# Altium schematic sheet Relay_Driver.SchDoc
size A; SheetNumber: 3; SheetTotal: 4
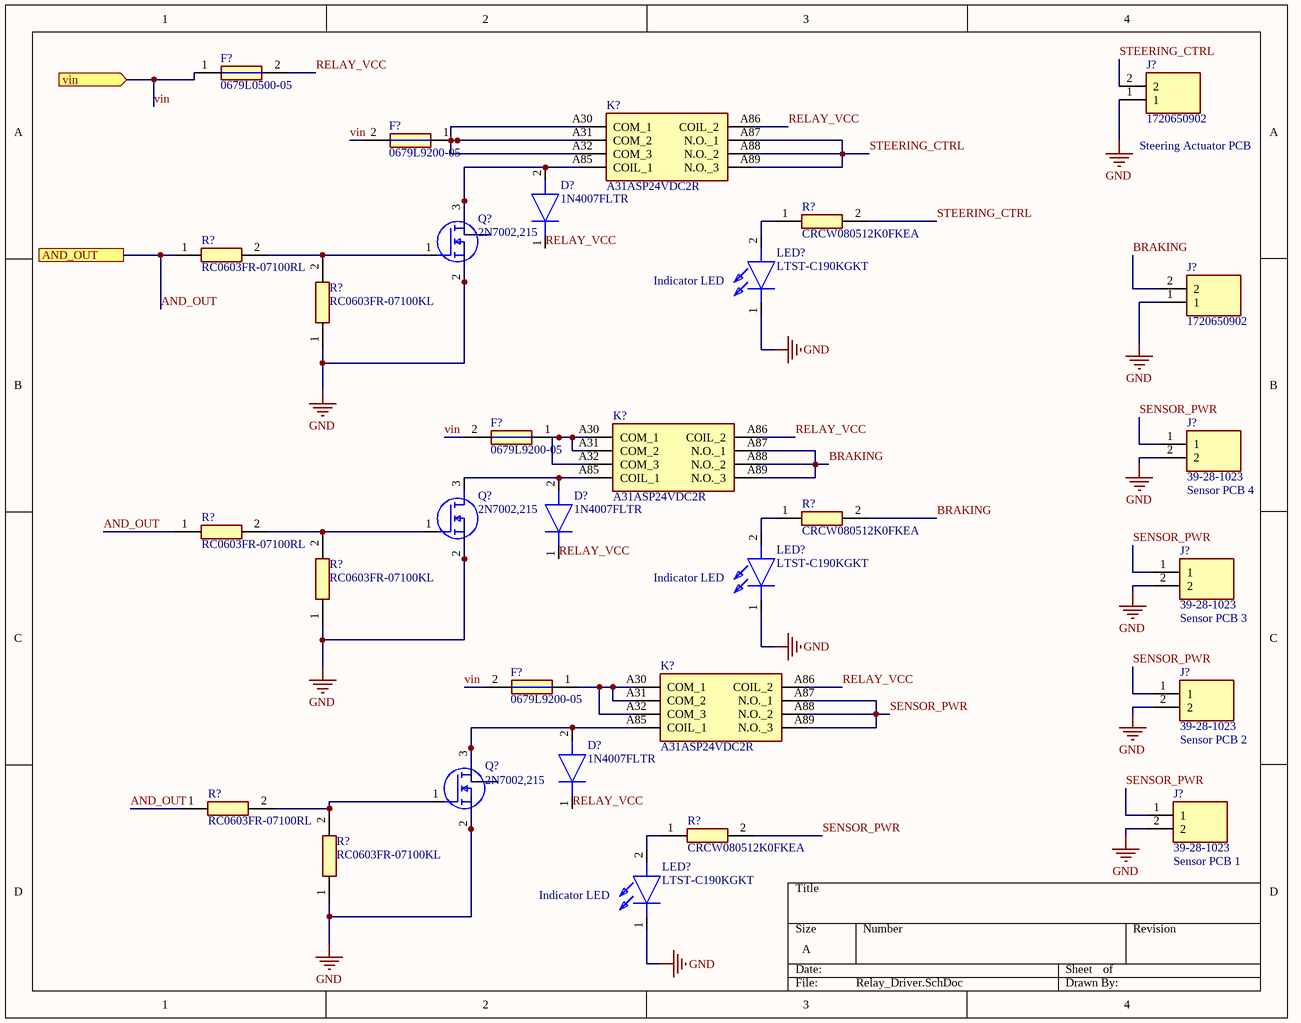
[diagram p0: Relay_Driver.SchDoc]

## Parts
(Parts that share a designator on the sheet are numbered #1, #2 ... from top to bottom, then left to right.)
D?#1  1N4007FLTR  [SODFL3718X140N]
D?#2  1N4007FLTR  [SODFL3718X140N]
D?#3  1N4007FLTR  [SODFL3718X140N]
F?#1  0679L0500-05  [FUSC6125X279N]
F?#2  0679L9200-05  [FUSC6125X279N]
F?#3  0679L9200-05  [FUSC6125X279N]
F?#4  0679L9200-05  [FUSC6125X279N]
J?#1  1720650902  [1720650902]
J?#2  1720650902  [1720650902]
J?#3  39-28-1023  [39-28-1023]
J?#4  39-28-1023  [39-28-1023]
J?#5  39-28-1023  [39-28-1023]
J?#6  39-28-1023  [39-28-1023]
K?#1  A31ASP24VDC2R  [A31ASP24VDC2R]
K?#2  A31ASP24VDC2R  [A31ASP24VDC2R]
K?#3  A31ASP24VDC2R  [A31ASP24VDC2R]
LED?#1  LTST-C190KGKT  [LEDC1608X80N]
LED?#2  LTST-C190KGKT  [LEDC1608X80N]
LED?#3  LTST-C190KGKT  [LEDC1608X80N]
Q?#1  2N7002,215  [SOT95P230X110-3N]
Q?#2  2N7002,215  [SOT95P230X110-3N]
Q?#3  2N7002,215  [SOT95P230X110-3N]
R?#1  CRCW080512K0FKEA  [RESC2012X50N]
R?#2  RC0603FR-07100RL  [RESC1608X55N]
R?#3  RC0603FR-07100KL  [RESC1608X55N]
R?#4  CRCW080512K0FKEA  [RESC2012X50N]
R?#5  RC0603FR-07100RL  [RESC1608X55N]
R?#6  RC0603FR-07100KL  [RESC1608X55N]
R?#7  RC0603FR-07100RL  [RESC1608X55N]
R?#8  CRCW080512K0FKEA  [RESC2012X50N]
R?#9  RC0603FR-07100KL  [RESC1608X55N]

## Ports
AND_OUT, vin (in)

## Nets
GND: J?#1.1 J?#2.1 J?#3.2 J?#4.2 J?#5.2 J?#6.2 LED?#1.1(K) LED?#2.1(K) LED?#3.1(K) Q?#1.2(S) Q?#2.2(S) Q?#3.2(S) R?#3.1 R?#6.1 R?#9.1
AND_OUT: R?#2.1 R?#5.1 R?#7.1 ; port AND_OUT
BRAKING: J?#2.2 K?#2.A87(N.O._1) K?#2.A88(N.O._2) K?#2.A89(N.O._3) R?#4.2
RELAY_VCC: D?#1.1(K) D?#2.1(K) D?#3.1(K) F?#1.2 K?#1.A86(COIL_2) K?#2.A86(COIL_2) K?#3.A86(COIL_2)
SENSOR_PWR: J?#3.1 J?#4.1 J?#5.1 J?#6.1 K?#3.A87(N.O._1) K?#3.A88(N.O._2) K?#3.A89(N.O._3) R?#8.2
STEERING_CTRL: J?#1.2 K?#1.A87(N.O._1) K?#1.A88(N.O._2) K?#1.A89(N.O._3) R?#1.2
vin: F?#1.1 F?#2.2 F?#3.2 F?#4.2 ; port vin
NetD?#1_2: D?#1.2(A) K?#1.A85(COIL_1) Q?#1.3(D)
NetD?#2_2: D?#2.2(A) K?#2.A85(COIL_1) Q?#2.3(D)
NetD?#3_2: D?#3.2(A) K?#3.A85(COIL_1) Q?#3.3(D)
NetF?#2_1: F?#2.1 K?#1.A30(COM_1) K?#1.A31(COM_2) K?#1.A32(COM_3)
NetF?#3_1: F?#3.1 K?#2.A30(COM_1) K?#2.A31(COM_2) K?#2.A32(COM_3)
NetF?#4_1: F?#4.1 K?#3.A30(COM_1) K?#3.A31(COM_2) K?#3.A32(COM_3)
NetLED?#1_2: LED?#1.2(A) R?#1.1
NetLED?#2_2: LED?#2.2(A) R?#4.1
NetLED?#3_2: LED?#3.2(A) R?#8.1
NetQ?#1_1: Q?#1.1(G) R?#2.2 R?#3.2
NetQ?#2_1: Q?#2.1(G) R?#5.2 R?#6.2
NetQ?#3_1: Q?#3.1(G) R?#7.2 R?#9.2

## Notes on the sheet
- (near J?#1) Steering Actuator PCB
- (near LED?#1) Indicator LED
- (near J?#3) Sensor PCB 4
- (near LED?#2) Indicator LED
- (near J?#4) Sensor PCB 3
- (near J?#5) Sensor PCB 2
- (near LED?#3) Indicator LED
- (near J?#6) Sensor PCB 1

## Library data of the parts
D?#1-D?#3 = 1N4007FLTR: Diode; Manufacturer_Name: SMC Diode Solutions; Datasheet Link: http://www.smc-diodes.com/propdf/1N4001FL-1N4007FL%20N1646%20REV.A.pdf; Height: 1.4mm; Manufacturer_Part_Number: 1N4007FLTR
F?#1 = 0679L0500-05: Fuse; Manufacturer_Name: Bel Circuit Protection; Datasheet Link: https://au.mouser.com/datasheet/2/643/ds_cp_0679l_series-1291227.pdf; Height: 2.79mm; Manufacturer_Part_Number: 0679L0500-05; Arrow Part Number: 0679L0500-05; Arrow Price/Stock: https://www.arrow.com/en/products/0679l0500-05/bel-group
F?#2-F?#4 = 0679L9200-05: Fuse; Manufacturer_Name: BelFuse; Datasheet Link: https://mouser.componentsearchengine.com/Datasheets/1/0679L9200-05.pdf; Height: 2.79mm; Manufacturer_Part_Number: 0679L9200-05; Mouser Part Number: 530-0679L9200-05; Mouser Price/Stock: https://www.mouser.co.uk/ProductDetail/Bel-Fuse/0679L9200-05?qs=ZqXcJfGlKsjLkLjgIYVYTw%3D%3D; Arrow Part Number: 0679L9200-05; Arrow Price/Stock: https://www.arrow.com/en/products/0679l9200-05/bel-group
J?#1 J?#2 = 1720650902: Connector; Manufacturer_Name: Molex; Datasheet Link: https://www.molex.com/content/dam/molex/molex-dot-com/products/automated/en-us/salesdrawingpdf/172/172065/1720650902_sd.pdf; Height: 15.2mm; Manufacturer_Part_Number: 1720650902
J?#3-J?#6 = 39-28-1023: Connector; Manufacturer_Name: Molex; Datasheet Link: https://www.molex.com/pdm_docs/sd/039281023_sd.pdf; Height: 12.8mm; Manufacturer_Part_Number: 39-28-1023; Mouser Part Number: 538-39-28-1023; Mouser Price/Stock: https://www.mouser.co.uk/ProductDetail/Molex/39-28-1023?qs=LQQHZ4xw2XBykFU0jRHvlQ%3D%3D; Arrow Part Number: 39-28-1023; Arrow Price/Stock: https://www.arrow.com/en/products/39-28-1023/molex?region=nac
K?#1-K?#3 = A31ASP24VDC2R: Relay or Contactor; Manufacturer_Name: CIT Relay & Switch; Datasheet Link: https://www.citrelay.com/CatalogPages/RelayCatalog/A3.pdf; Height: 27.55mm; Manufacturer_Part_Number: A31ASP24VDC2R
LED?#1-LED?#3 = LTST-C190KGKT: LED; Manufacturer_Name: Lite-On; Datasheet Link: http://uk.rs-online.com/web/p/visible-leds/6920988/; Height: 0.8mm; Manufacturer_Part_Number: LTST-C190KGKT; Mouser Part Number: 859-LTST-C190KGKT; Mouser Price/Stock: https://www.mouser.co.uk/ProductDetail/Lite-On/LTST-C190KGKT?qs=205qCy6M2Q%252BAdcgwUZktqw%3D%3D; Arrow Part Number: LTST-C190KGKT; Arrow Price/Stock: https://www.arrow.com/en/products/ltst-c190kgkt/lite-on-technology.html?utm_currency=USD&region=europe
Q?#1-Q?#3 = 2N7002,215: MOSFET (N-Channel); Manufacturer_Name: Nexperia; Datasheet Link: https://assets.nexperia.com/documents/data-sheet/2N7002.pdf; Height: 1.1mm; Manufacturer_Part_Number: 2N7002,215; Mouser Part Number: 771-2N7002-T/R; Mouser Price/Stock: https://www.mouser.co.uk/ProductDetail/Nexperia/2N7002215?qs=P62ublwmbi9rRKKuNdhqMA%3D%3D; Arrow Part Number: 2N7002,215; Arrow Price/Stock: https://www.arrow.com/en/products/2n7002215/nexperia?utm_currency=USD&region=nac
R?#1 R?#4 R?#8 = CRCW080512K0FKEA: Resistor; Manufacturer_Name: Vishay; Datasheet Link: http://www.vishay.com/docs/20035/dcrcwe3.pdf; Height: 0.5mm; Manufacturer_Part_Number: CRCW080512K0FKEA; Mouser Part Number: 71-CRCW080512K0FKEA; Mouser Price/Stock: https://www.mouser.co.uk/ProductDetail/Vishay-Dale/CRCW080512K0FKEA?qs=0y7Riw94L4gQIm4gt5oa2A%3D%3D; Arrow Part Number: CRCW080512K0FKEA; Arrow Price/Stock: https://www.arrow.com/en/products/crcw080512k0fkea/vishay?region=europe
R?#2 R?#5 R?#7 = RC0603FR-07100RL: Resistor; Manufacturer_Name: Yageo Group; Datasheet Link: http://www.yageo.com/documents/recent/PYu-RC0603_51_RoHS_L_v5.pdf; Height: 0.55mm; Manufacturer_Part_Number: RC0603FR-07100RL; Mouser Part Number: 603-RC0603FR-07100RL; Mouser Price/Stock: https://www.mouser.co.uk/ProductDetail/YAGEO/RC0603FR-07100RL?qs=NEN%2FsE%2FLsvPIwIWKCOS4%2FA%3D%3D; Arrow Part Number: RC0603FR-07100RL; Arrow Price/Stock: https://www.arrow.com/en/products/rc0603fr-07100rl/yageo.html?utm_currency=USD&region=nac
R?#3 R?#6 R?#9 = RC0603FR-07100KL: Resistor; Manufacturer_Name: Yageo Group; Datasheet Link: https://www.yageo.com/upload/media/product/productsearch/datasheet/rchip/PYu-RC_Group_51_RoHS_L_12.pdf; Height: 0.55mm; Manufacturer_Part_Number: RC0603FR-07100KL; Mouser Part Number: 603-RC0603FR-07100KL; Mouser Price/Stock: https://www.mouser.co.uk/ProductDetail/YAGEO/RC0603FR-07100KL?qs=e1ok2LiJcmaihem8Va5%2Fsw%3D%3D; Arrow Part Number: RC0603FR-07100KL; Arrow Price/Stock: https://www.arrow.com/en/products/rc0603fr-07100kl/yageo.html?utm_currency=USD&region=europe